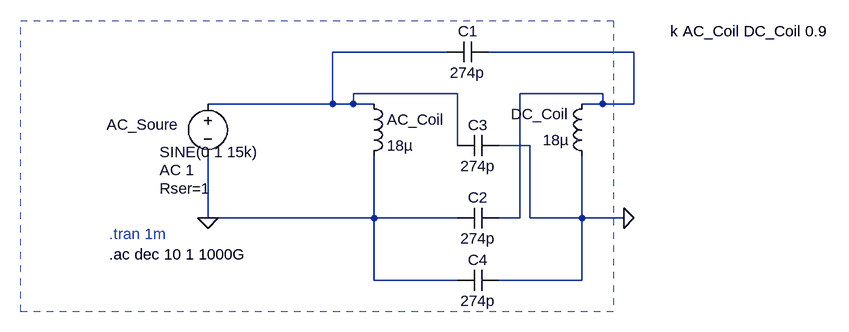
[diagram p0: schematic initial_model_LTspice.asc]
initial_model_LTspice.asc, the LTspice schematic file:
Version 4.1
SHEET 1 900 680
WIRE 240 32 64 32
WIRE 528 32 304 32
WIRE 256 96 96 96
WIRE 480 96 352 96
WIRE 64 112 64 32
WIRE 64 112 -128 112
WIRE 96 112 96 96
WIRE 96 112 64 112
WIRE 128 112 96 112
WIRE 480 112 480 96
WIRE 480 112 448 112
WIRE 528 112 528 32
WIRE 528 112 480 112
WIRE 256 176 256 96
WIRE 368 176 320 176
WIRE -128 288 -128 192
WIRE 128 288 128 192
WIRE 128 288 -128 288
WIRE 256 288 128 288
WIRE 352 288 352 96
WIRE 352 288 320 288
WIRE 368 288 368 176
WIRE 448 288 448 192
WIRE 448 288 368 288
WIRE 512 288 448 288
WIRE 128 384 128 288
WIRE 256 384 128 384
WIRE 448 384 448 288
WIRE 448 384 320 384
FLAG -128 288 0
FLAG 512 288 0
SYMBOL ind 112 96 R0
SYMATTR InstName AC_Coil
SYMATTR Value 18µ
SYMATTR Type ind
SYMATTR SpiceLine Rser=7.31
SYMBOL ind 464 208 R180
WINDOW 0 36 80 Left 2
WINDOW 3 36 40 Left 2
SYMATTR InstName DC_Coil
SYMATTR Value 18µ
SYMATTR Type ind
SYMATTR SpiceLine Rser=7.31
SYMBOL voltage -128 96 R0
WINDOW 0 -156 48 Left 2
WINDOW 3 -74 90 Left 2
WINDOW 123 -74 118 Left 2
WINDOW 39 -74 146 Left 2
SYMATTR InstName AC_Soure
SYMATTR Value SINE(0 1 15k)
SYMATTR Value2 AC 1
SYMATTR SpiceLine Rser=1
SYMBOL cap 304 16 R90
WINDOW 0 0 32 VBottom 2
WINDOW 3 32 32 VTop 2
SYMATTR InstName C1
SYMATTR Value 274p
SYMBOL cap 320 272 R90
WINDOW 0 0 32 VBottom 2
WINDOW 3 32 32 VTop 2
SYMATTR InstName C2
SYMATTR Value 274p
SYMBOL cap 320 160 R90
WINDOW 0 0 32 VBottom 2
WINDOW 3 32 32 VTop 2
SYMATTR InstName C3
SYMATTR Value 274p
SYMBOL cap 320 368 R90
WINDOW 0 0 32 VBottom 2
WINDOW 3 32 32 VTop 2
SYMATTR InstName C4
SYMATTR Value 274p
TEXT -280 312 Left 2 ;.tran 1m
TEXT 584 0 Left 2 !k AC_Coil DC_Coil 0.9
TEXT -280 344 Left 2 !.ac dec 10 1 1000G
RECTANGLE Normal 496 432 -416 -16 2

The netlist it stands for:
* initial_model_LTspice.asc
L§AC_Coil N001 0 18µ Rser=7.31
L§DC_Coil 0 N002 18µ Rser=7.31
V§AC_Soure N001 0 SINE(0 1 15k) AC 1 Rser=1
C1 N002 N001 274p
C2 N002 0 274p
C3 0 N001 274p
C4 0 0 274p
* .tran 1m
k AC_Coil DC_Coil 0.9
.ac dec 10 1 1000G
.backanno
.end